# Altium schematic sheet charge_management.SchDoc
size A4; SheetNumber: 3; SheetTotal: 5
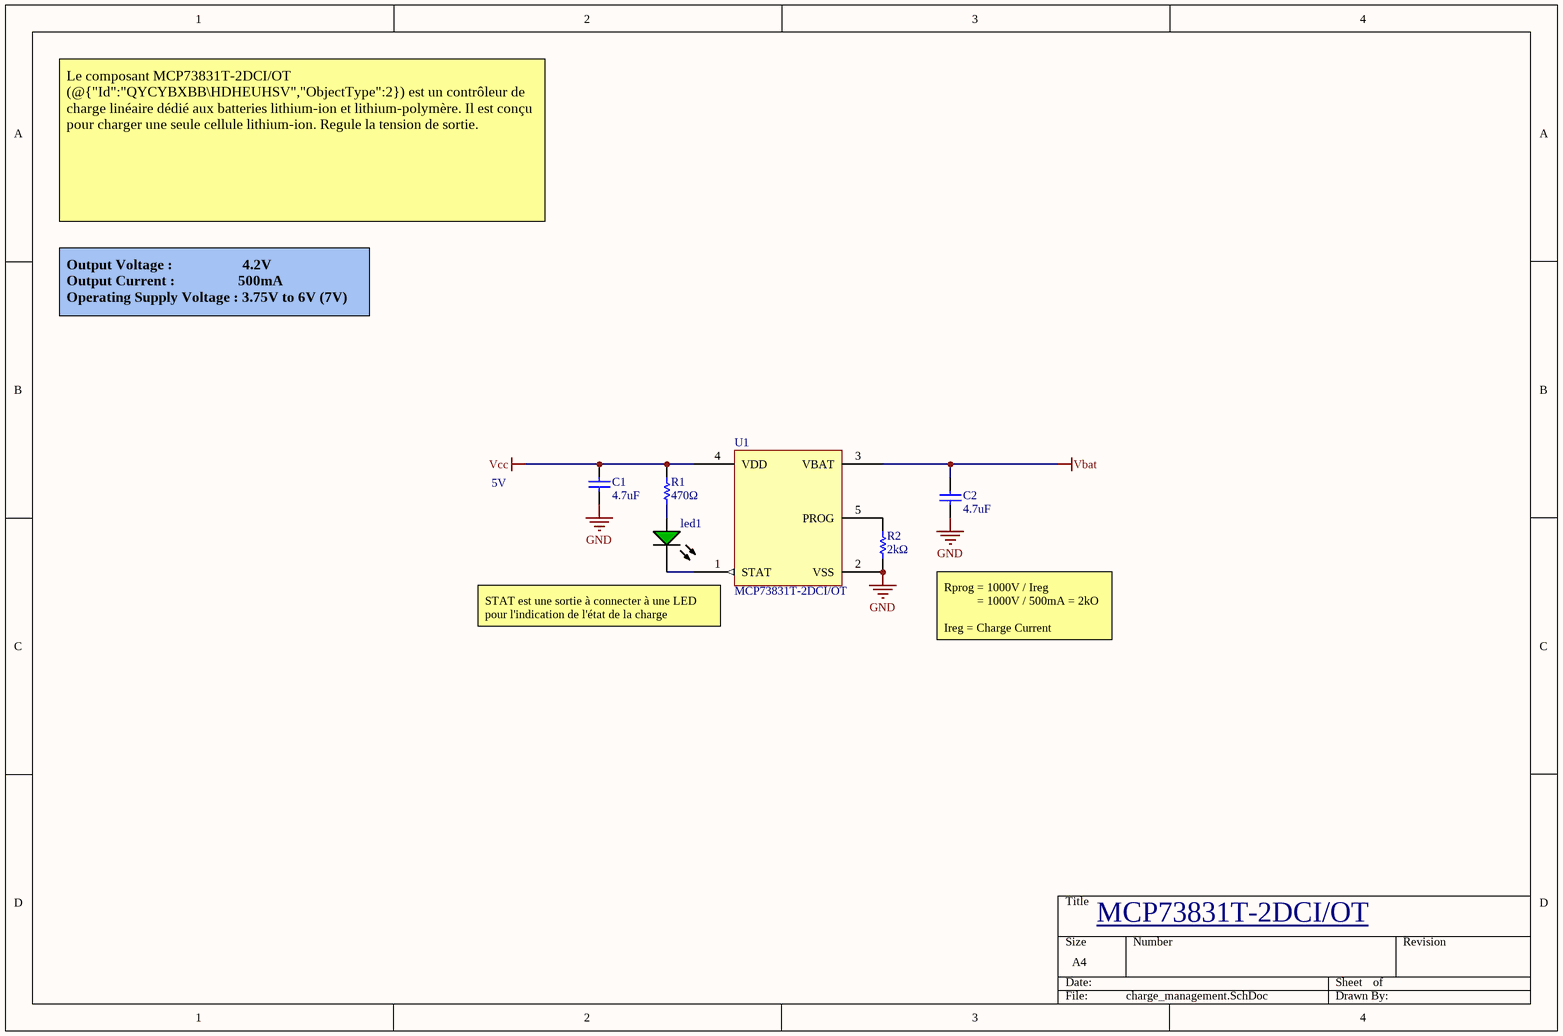
[diagram p0: charge_management.SchDoc]

## Parts
C1  4.7uF  [CAPC0603(1608)100_M]
C2  4.7uF  [CAPC0603(1608)100_M]
led1  598-8070-107F  [DIAL-0603-2_V]  (value not drawn)
R1  470Ω  [RESC1608X55X30NL15T15]
R2  2kΩ  [RESC1608X55X30ML15T15]
U1  MCP73831T-2DCI/OT  [MCP73831T-2DCI/OT]

## Nets
GND: C1.1 C2.1 R2.1 U1.2(VSS)
Vbat: C2.2 U1.3(VBAT)
Vcc: C1.2 R1.2 U1.4(VDD)
Netled1_1: led1.1(K) U1.1(STAT)
Netled1_2: led1.2(A) R1.1
NetR2_2: R2.2 U1.5(PROG)

## Notes on the sheet
- Le composant MCP73831T-2DCI/OT (@{"Id":"QYCYBXBB\HDHEUHSV","ObjectType":2}) est un contrôleur de charge linéaire dédié aux batteries lithium-ion et lithium-polymère. Il est conçu pour charger une seule cellule lithium-ion. Regule la tension de sortie.
- Output Voltage :                    4.2V
  Output Current :                  500mA
  Operating Supply Voltage : 3.75V to 6V (7V)
- 5V
- (near U1) STAT est une sortie à connecter à une LED pour l'indication de l'état de la charge
- Rprog = 1000V / Ireg
  = 1000V / 500mA = 2kO
  Ireg = Charge Current
- MCP73831T-2DCI/OT <https://www.mouser.ch/ProductDetail/Microchip-Technology/MCP73831T-2DCI-OT?qs=yUQqVecv4qu38ml9qkvsJw%3D%3D>

## Library data of the parts
C1 C2 = CMP-1035-02783-1: CAP 4.7uF 6.3V -20% to +80% 0603 (1608 Metric) Thickness 1mm SMD; Case-Metric: 1608; Case-EIA: 0603; Tolerance: -20% to +80%; Rated Voltage: 6.3 V; Value: 4.7uF; Technology: SMT; Max Thickness: 1 mm
led1 = CMP-2000-05654-1: Single Color LED, 2 V, -30 to 85 degC, 2-Pin SMD (0603), RoHS, Tape and Reel; Manufacturer: Dialight; Power Dissipation: 60W; DELETED: Compliant; Number of  Elements: 1; Viewing Angle: 140deg; Dominant Wave Length: 568nm; Product Depth (mm): 0.8mm; Emitting Color: YellowGreen; Main Category: ChipLED; Product Length (mm): 1.6mm; Type: Uni-Color; Forward Voltage: 2.4V; Luminous Intensity: 20mcd; High Brightness: No; Forward Current: 25mA; Test Current (It): 20mA; Shape Type: Rectangular; Reverse Voltage: 5V; Product Height (mm): 0.7mm; Chip Material: GaP; Mounting: SurfaceMount; Package Description: 2-Pin Surface Mount Device, Body 1.6 x 0.8 mm; Package Type: SMD; Operating Temperature Classification: Industrial; Package Reference: 0603; Datasheet Version: Rev. 2, 10/2008; Lens Dimensions: 1.1x0.8x0.4mm; Pin Count: 2; Manufacturer URL: http://www.dialight.com/; Mounting Technology: SurfaceMount; Operating Temp Range: -40Cto100C; Packaging: TapeandReel; Rad Hardened: No; Datasheet URL: https://datasheet.ciiva.com/4688/598-selectorguide-18902-4688880.pdf; Lum Intensity: 20mcd
R1 = CMP-2000-00795-1: Part Number: ERJ-3GEYJ471V; Manufacturer: Panasonic
R2 = CMP-2000-00317-1: Part Number: ERJ-3EKF2001V; Manufacturer: Panasonic